# Altium project Industrial_IOT_Dev_Brd-v1.0.PrjPcb (part 4 of 7)

## Sheet Controller-Sheet.SchDoc
size 420 x 297 mm; SheetNumber: 3; SheetTotal: 9
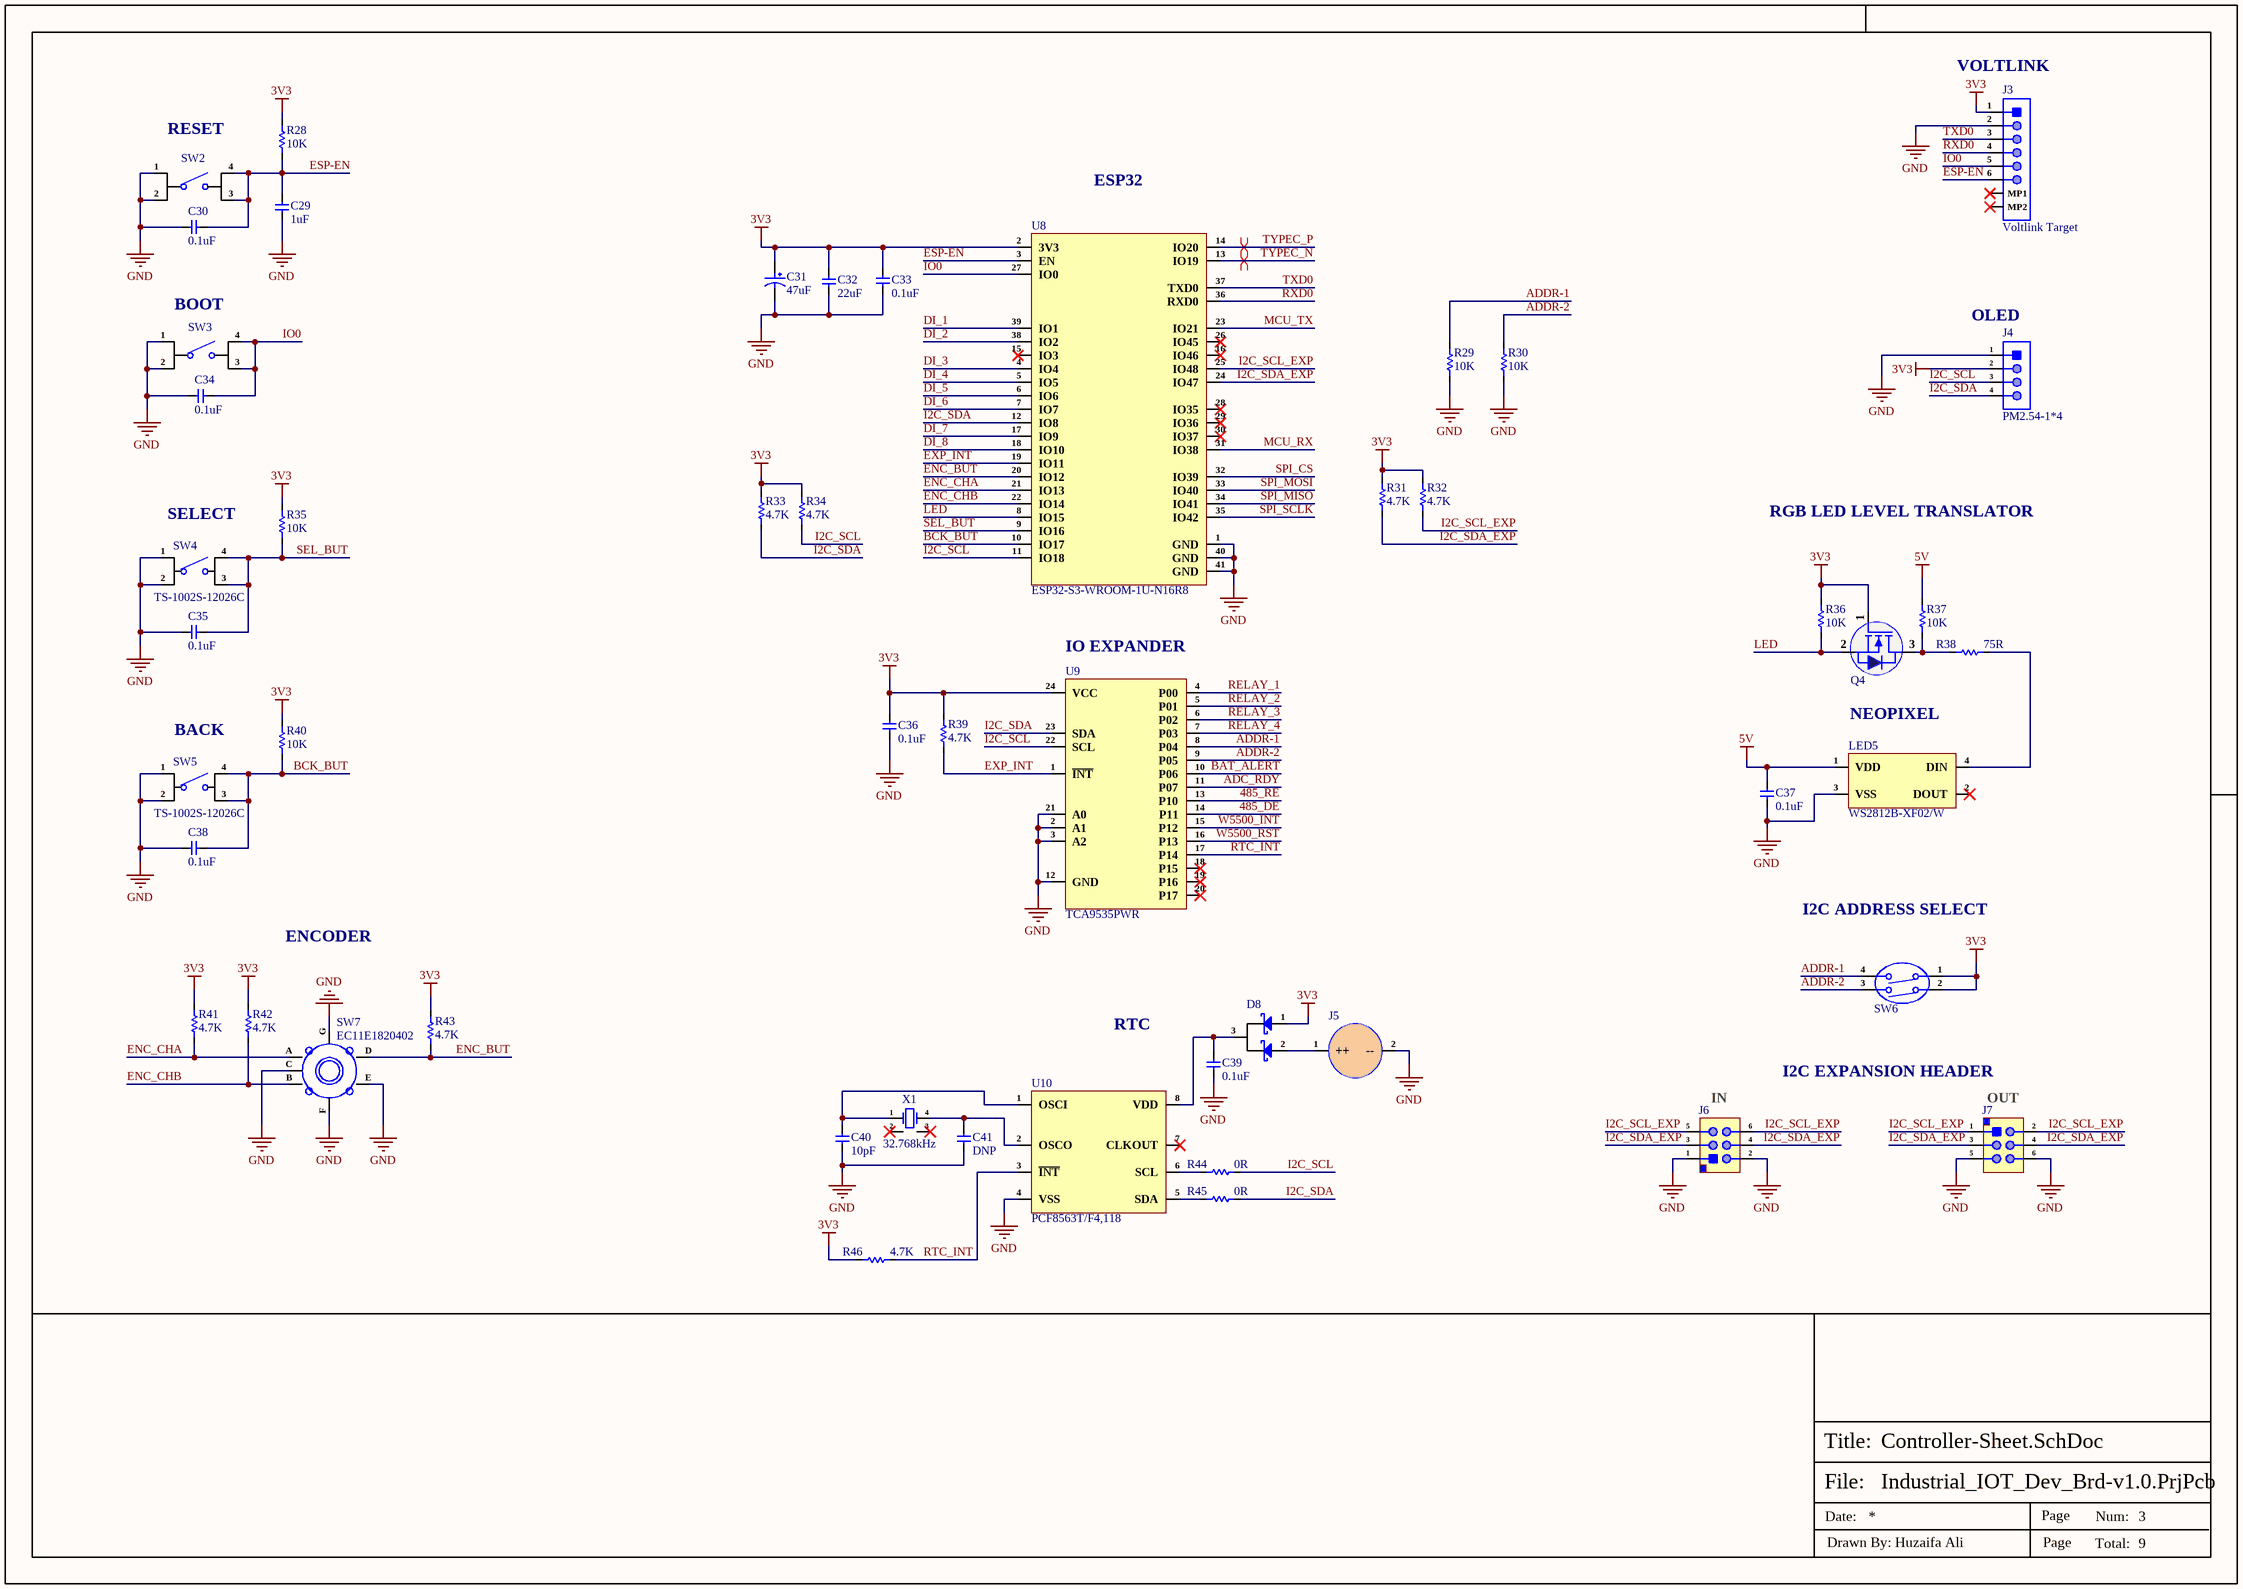
[diagram p2: Controller-Sheet.SchDoc]

### Parts
C29  1uF  [Cap-0402]
C30  0.1uF  [Cap-0402]
C31  47uF  [RVT1E470M0505]
C32  22uF  [Cap-0805]
C33  0.1uF  [Cap-0402]
C34  0.1uF  [Cap-0402]
C35  0.1uF  [Cap-0402]
C36  0.1uF  [Cap-0402]
C37  0.1uF  [Cap-0402]
C38  0.1uF  [Cap-0402]
C39  0.1uF  [Cap-0402]
C40  10pF  [Cap-0402]
C41  DNP  [Cap-0402]
D8  BAT54C  [SOT-23]  (value not drawn)
J3  Voltlink Target  [Voltlink Target]
J4  PM2.54-1*4  [HDR1X4 Female]
J5  CR2032-BS-6-1  [CR2032-BS-6-1]  (value not drawn)
J6  XDFH-0259-2*3P  [XDFH-0259-2*3P]  (value not drawn)
J7  XDFH-0259-2*3P  [XDFH-0259-2*3P]  (value not drawn)
LED5  WS2812B-XF02/W  [WS2812B-XF02/W]
Q4  Si2302CDS  [Sot-23]  (value not drawn)
R28  10K  [Res-0603]
R29  10K  [Res-0603]
R30  10K  [Res-0603]
R31  4.7K  [Res-0402]
R32  4.7K  [Res-0402]
R33  4.7K  [Res-0402]
R34  4.7K  [Res-0402]
R35  10K  [Res-0603]
R36  10K  [Res-0402]
R37  10K  [Res-0402]
R38  75R  [Res-0402]
R39  4.7K  [Res-0402]
R40  10K  [Res-0603]
R41  4.7K  [Res-0402]
R42  4.7K  [Res-0402]
R43  4.7K  [Res-0402]
R44  0R  [Res-0402]
R45  0R  [Res-0402]
R46  4.7K  [Res-0402]
SW2  TS-1109S-C-B  [TS-1109S-C-B]  (value not drawn)
SW3  TS-1109S-C-B  [TS-1109S-C-B]  (value not drawn)
SW4  TS-1002S-12026C  [TS-1002S-12026C]
SW5  TS-1002S-12026C  [TS-1002S-12026C]
SW6  DPL-02RP  [DPL-02RP]  (value not drawn)
SW7  EC11E1820402  [EC11E1820402]
U8  ESP32-S3-WROOM-1U-N16R8  [41-SMD UFL Module]
U9  TCA9535PWR  [24-TSSOP]
U10  PCF8563T/F4,118  [SOIC-8(0.154", 3.90mm Width)]
X1  32.768kHz  [MC-146_]

### Nets
3V3: C31.1 C32.2 C33.1 C36.1 D8.1(A) J3.1 J4.2 Q4.1(G) R28.2 R31.2 R32.2 R33.2 R34.2 R35.2 R36.2 R39.2 R40.2 R41.2 R42.2 R43.2 R46.2 SW6.1 SW6.2 U8.2(3V3) U9.24(VCC)
5V: C37.1 LED5.1(VDD) R37.2
GND: C29.1 C30.1 C31.2 C32.1 C33.2 C34.1 C35.1 C36.2 C37.2 C38.1 C39.1 C40.1 C41.1 J3.2 J4.1 J5.2(--) J6.1 J6.2 J7.5 J7.6 LED5.3(VSS) R29.1 R30.1 SW2.1 SW2.2 SW3.1 SW3.2 SW4.1 SW4.2 SW5.1 SW5.2 SW7.C SW7.E SW7.F SW7.G U8.1(GND) U8.40(GND) U8.41(GND) U9.2(A1) U9.3(A2) U9.12(GND) U9.21(A0) U10.4(VSS)
485_DE: U9.14(P11)
485_RE: U9.13(P10)
ADC_RDY: U9.11(P07)
ADDR-1: R29.2 SW6.4 U9.8(P04)
ADDR-2: R30.2 SW6.3 U9.9(P05)
BAT_ALERT: U9.10(P06)
BCK_BUT: C38.2 R40.1 SW5.3 SW5.4 U8.10(IO17)
DI_1: U8.39(IO1)
DI_2: U8.38(IO2)
DI_3: U8.4(IO4)
DI_4: U8.5(IO5)
DI_5: U8.6(IO6)
DI_6: U8.7(IO7)
DI_7: U8.17(IO9)
DI_8: U8.18(IO10)
ENC_BUT: R43.1 SW7.D U8.20(IO12)
ENC_CHA: R41.1 SW7.A U8.21(IO13)
ENC_CHB: R42.1 SW7.B U8.22(IO14)
ESP-EN: C29.2 C30.2 J3.6 R28.1 SW2.3 SW2.4 U8.3(EN)
EXP_INT: R39.1 U8.19(IO11) U9.1(~{INT})
I2C_SCL: J4.3 R34.1 R44.2 U8.11(IO18) U9.22(SCL)
I2C_SCL_EXP: J6.5 J6.6 J7.1 J7.2 R32.1 U8.25(IO48)
I2C_SDA: J4.4 R33.1 R45.2 U8.12(IO8) U9.23(SDA)
I2C_SDA_EXP: J6.3 J6.4 J7.3 J7.4 R31.1 U8.24(IO47)
IO0: C34.2 J3.5 SW3.3 SW3.4 U8.27(IO0)
LED: Q4.2(S) R36.1 U8.8(IO15)
MCU_RX: U8.31(IO38)
MCU_TX: U8.23(IO21)
RELAY_1: U9.4(P00)
RELAY_2: U9.5(P01)
RELAY_3: U9.6(P02)
RELAY_4: U9.7(P03)
RTC_INT: R46.1 U9.17(P14) U10.3(~{INT})
RXD0: J3.4 U8.36(RXD0)
SEL_BUT: C35.2 R35.1 SW4.3 SW4.4 U8.9(IO16)
SPI_CS: U8.32(IO39)
SPI_MISO: U8.34(IO41)
SPI_MOSI: U8.33(IO40)
SPI_SCLK: U8.35(IO42)
TXD0: J3.3 U8.37(TXD0)
TYPEC_N: U8.13(IO19)
TYPEC_P: U8.14(IO20)
W5500_INT: U9.15(P12)
W5500_RST: U9.16(P13)
NetC39_2: C39.2 D8.3(K) U10.8(VDD)
NetC40_2: C40.2 U10.1(OSCI) X1.1(OSC1)
NetC41_2: C41.2 U10.2(OSCO) X1.4(OSC2)
NetD8_2: D8.2(A) J5.1(++)
NetLED5_4: LED5.4(DIN) R38.2
NetQ4_3: Q4.3(D) R37.1 R38.1
NetR44_1: R44.1 U10.6(SCL)
NetR45_1: R45.1 U10.5(SDA)

Not connected (* = marked no-connect by the designer): J3 MP1* MP2*; LED5 2(DOUT)*; U8 15(IO3)* 16(IO46)* 26(IO45)* 28(IO35)* 29(IO36)* 30(IO37)*; U9 18(P15)* 19(P16)* 20(P17)*; U10 7(CLKOUT)*; X1 2(GND)* 3(GND)*

### Layout directives
differential pair; net class USB_PROGRAM; differential pair class USB_PROGRAM_LINES; rule Impedance Constraint [Min = 85.00    Max = 90.00    ]; rule Matched Net Lengths [Tolerance = 50mil]: TYPEC_N, TYPEC_P

### Notes on the sheet
- (near J3) VOLTLINK
- (near SW2) RESET
- ESP32
- (near SW3) BOOT
- (near J4) OLED
- (near SW4) SELECT
- RGB LED LEVEL TRANSLATOR
- (near U9) IO EXPANDER
- NEOPIXEL
- (near SW5) BACK
- ENCODER
- I2C ADDRESS SELECT
- RTC
- I2C EXPANSION HEADER
- (near J6) IN
- (near J7) OUT
- File:
- Title:
- Date:
- Page
- Num:
- Total:
- Drawn By: Huzaifa Ali

### Library data of the parts
C29 = GRM155R70J105KA12J: CAP CER 1UF 6.3V X7R 0402; Manufacturer: Murata; Item Type: Capacitors; Material: 4241ConductorMaterial; Tolerance: 10%; Supplier: Mouser; LCSC Part Number: C2167130; Manufacturer Part Number: GRM155R70J105KA12J; RoHS: Yes; Stock: 273640; Pricing: 1=0.1, 10=0.01, 50=0.01, 100=0.008, 1000=0.008, 10000=0.007 (USD); Mounting Technology: Surface Mount; Case/Package: 0402; Pins: 2NUMBER; Case Code (Metric): 1005; Case Code (Imperial): 0402; Weight: 0.000212oz; Min Operating Temperature: -55°C; Max Operating Temperature: 125°C; Packaging: Tape and Reel; Value: 1uF; Voltage Rating: 6.3V; Dielectric: X7R; Termination: SMD/SMT; Voltage Rating (DC): 6.3V; Package Quantity: 50000; Series: GRM; Length: 0.039inch; Width: 0.02inch; Height: 550um; Thickness: 0.022inch; RoHS Compliant: Yes; ComponentLink1URL: http://www.mouser.com/ds/2/281/c02e-2905.pdf?src-supplier=Mouser; ComponentLink1Description: http://www.mouser.com/ds/2/281/c02e-2905.pdf?src-supplier=Mouser; ComponentLink2URL: https://datasheet.octopart.com/GRM155R70J105KA12J-Murata-datasheet-32479577.pdf?src-supplier=Future+Electronics; ComponentLink2Description: https://datasheet.octopart.com/GRM155R70J105KA12J-Murata-datasheet-32479577.pdf?src-supplier=Future+Electronics; ComponentLink3URL: https://datasheet.octopart.com/GRM155R70J105KA12J-Murata-datasheet-155345054.pdf?src-supplier=Element14; ComponentLink3Description: https://datasheet.octopart.com/GRM155R70J105KA12J-Murata-datasheet-155345054.pdf?src-supplier=Element14; ComponentLink4URL: http://search.murata.co.jp/Ceramy/image/img/A01X/G101/ENG/GRM155R70J105KA12-01.pdf?src-supplier=Digikey; ComponentLink4Description: http://search.murata.co.jp/Ceramy/image/img/A01X/G101/ENG/GRM155R70J105KA12-01.pdf?src-supplier=Digikey; ComponentLink5URL: https://datasheet.octopart.com/GRM155R70J105KA12J-Murata-datasheet-165579666.pdf?src-supplier=TME; ComponentLink5Description: https://datasheet.octopart.com/GRM155R70J105KA12J-Murata-datasheet-165579666.pdf?src-supplier=TME
C30 C33-C39 = CC0402JRX7R7BB104: CAP CER 0.1UF 16V X7R 0402; Manufacturer: Yageo; Material: 4241ConductorMaterial; Value: 100nF; Tolerance: 5%; Item Type: Capacitor; Supplier: Digikey; Supplier Part Number: 311-1676-1-ND; Manufacturer Part Number: CC0402JRX7R7BB104; RoHS: Yes; Category: Ceramic Capacitors; Stock: 1659111; Pricing: 1=0.1, 10=0.046, 50=0.0262, 100=0.0203, 500=0.01528, 1000=0.012, 2500=0.01091, 5000=0.01004 (USD); Mounting Technology: Surface Mount; Case/Package: 0402; Case Code (Metric): 1005; Case Code (Imperial): 0402; Min Operating Temperature: -55°C; Max Operating Temperature: 125°C; Dielectric: X7R; Packaging: Tape and Reel; Package Quantity: 10000; Voltage Rating (DC): 16V; Voltage Rating: 16V; Series: CC; Construction: Flat; Length: 0.039inch; Width: 0.02inch; Height: 0.5mm; Thickness: 0.022inch; Lead Free: Lead Free; Halogen Free: Halogen Free; RoHS Compliant: Yes; ComponentLink1URL: https://datasheet.ciiva.com/13210/upy-gphc-x7r-6-3v-to-50v-8-12304-13210152.pdf?src-supplier=Mouser; ComponentLink1Description: https://datasheet.ciiva.com/13210/upy-gphc-x7r-6-3v-to-50v-8-12304-13210152.pdf?src-supplier=Mouser; LCSC Part Number: C541464
C31 = RVT1E470M0505: 47uF 25V 49mA@120Hz ±20% SMD,D5xL5.4mm Aluminum Electrolytic Capacitors - SMD ROHS; Manufacturer: ROQANG; Manufacturer Part Number: RVT1E470M0505; Package: SMD,D5xL5.4mm; LCSC Part Number: C2977553; Item Type: Capacitor; ComponentLink1Description: LCSC; ComponentLink1URL: https://www.lcsc.com/product-detail/Aluminum-Electrolytic-Capacitors-SMD_ROQANG-RVT1E470M0505_C2977553.html
C32 = GRM21BZ71A226ME15L: CAP CER 22UF 10V X7R 0805; Manufacturer: Murata; Material: 4241ConductorMaterial; Tolerance: 20%; Item Type: Capacitor; Supplier: Digi-Key; Supplier Part Number: 490-GRM21BZ71A226ME15LCT-ND; Manufacturer Part Number: GRM21BZ71A226ME15L; RoHS: Yes; Category: Ceramic Capacitors; Stock: 49126; Pricing: 1=0.39, 10=0.259, 50=0.191, 100=0.1556, 500=0.12282, 1000=0.10372 (USD); Package: 0805; Min Operating Temperature: -55°C; Max Operating Temperature: 125°C; Value: 22uF; Voltage Rating: 10V; Length: 2mm; Width: 1.25mm; Height: 1.45mm; Thickness: 1.25mm; ComponentLink1URL: https://datasheet.octopart.com/GRM21BZ71A226ME15L-Murata-datasheet-165579666.pdf?src-supplier=TME; ComponentLink1Description: https://datasheet.octopart.com/GRM21BZ71A226ME15L-Murata-datasheet-165579666.pdf?src-supplier=TME; LCSC Part Number: C907991; ComponentLink2Description: LCSC; ComponentLink2URL: https://www.lcsc.com/product-detail/Multilayer-Ceramic-Capacitors-MLCC-SMD-SMT_Murata-Electronics-GRM21BZ71A226ME15L_C907991.html
C40 C41 = GRM1555C1H100JA01D: CAP CER 10PF 50V C0G/NP0 0402; Manufacturer: Murata; Material: Ceramic; Dielectric: C0G; Tolerance: 5%; Item Type: Capacitor; Supplier: Arrow Electronics; Supplier Part Number: GRM1555C1H100JA01D; Manufacturer Part Number: GRM1555C1H100JA01D; RoHS: Yes; Category: Ceramic Capacitors; Stock: 3860000; Pricing: 10000=0.0034, 50000=0.0027, 100000=0.0023, 250000=0.0021 (USD); Mounting Technology: Surface Mount; Case/Package: 0402; Case Code (Metric): 1005; Case Code (Imperial): 0402; Min Operating Temperature: -55°C; Max Operating Temperature: 125°C; Value: 10pF; Voltage Rating: 50V; Packaging: Tape and Reel; Package Quantity: 1; Voltage Rating (DC): 50V; Termination: SMD/SMT; Series: GRM; Voltage: 50V; Construction: Flat; Length: 1mm; Width: 0.02inch; Height: 0.5mm; Depth: 0.5mm; Thickness: 0.022inch; Radiation Hardening: No; RoHS Compliant: Yes; Lead Free: Lead Free; Reach SVHC Compliant: No; ComponentLink1URL: https://datasheet.ciiva.com/2989/product-2989280.pdf?src-supplier=Avnet; ComponentLink1Description: https://datasheet.ciiva.com/2989/product-2989280.pdf?src-supplier=Avnet; ComponentLink2URL: https://datasheet.ciiva.com/18184/getdatasheetpartid-307234-18184164.pdf?src-supplier=Verical; ComponentLink2Description: https://datasheet.ciiva.com/18184/getdatasheetpartid-307234-18184164.pdf?src-supplier=Verical; ComponentLink3URL: https://datasheet.ciiva.com/29200/453545-da-01-en-vs-kondensator-0402-29200107.pdf?src-supplier=Conrad; ComponentLink3Description: https://datasheet.ciiva.com/29200/453545-da-01-en-vs-kondensator-0402-29200107.pdf?src-supplier=Conrad; ComponentLink4URL: https://datasheet.ciiva.com/7828/1666664-7828812.pdf?src-supplier=Element14; ComponentLink4Description: https://datasheet.ciiva.com/7828/1666664-7828812.pdf?src-supplier=Element14; ComponentLink5URL: https://datasheet.ciiva.com/6271/partnumbering-e-01-6271159.pdf?src-supplier=Digi-Key; ComponentLink5Description: https://datasheet.ciiva.com/6271/partnumbering-e-01-6271159.pdf?src-supplier=Digi-Key; ComponentLink6URL: https://datasheet.ciiva.com/6271/partnumbering-e-01-6271158.pdf?src-supplier=Digi-Key; ComponentLink6Description: https://datasheet.ciiva.com/6271/partnumbering-e-01-6271158.pdf?src-supplier=Digi-Key; ComponentLink7URL: https://datasheet.ciiva.com/6271/partnumbering-e-01-6271068.pdf?src-supplier=Digi-Key; ComponentLink7Description: https://datasheet.ciiva.com/6271/partnumbering-e-01-6271068.pdf?src-supplier=Digi-Key; LCSC Part Number: C76946
D8 = BAT54C: 30V Dual Common Cathode 1V@100mA 200mA SOT-23(TO-236) Schottky Barrier Diodes (SBD) ROHS; Manufacturer: Shandong Jingdao Microelectronics; Item Type: Diode; Manufacturer Part Number: BAT54C; LCSC Part Number: C2762215; ComponentLink1Description: LCSC; ComponentLink1URL: https://www.lcsc.com/product-detail/Schottky-Barrier-Diodes-SBD_Shandong-Jingdao-Microelectronics-BAT54C_C2762215.html; Package: SOT-23(TO-236)
J3 = C145963: 1x6P SH 1 1mm 6 SMD,P=1mm Wire To Board / Wire To Wire Connector ROHS; Manufacturer: BOOMELE; Manufacturer Part Number: C145963; Package: SMD,P=1mm; LCSC Part Number: C145963; Item Type: Connector; ComponentLink1Description: LCSC; ComponentLink1URL: https://www.lcsc.com/product-detail/Wire-To-Board-Wire-To-Wire-Connector_BOOMELE-Boom-Precision-Elec-C145963_C145963.html
J4 = PM2.54-1*4: 2mm 2.54mm Plugin 2.5A -40℃~+105℃ Straight 1x4P Top 8.5mm 4 Square Hole Plugin,P=2.54mm Female Headers ROHS; Manufacturer: ZHOURI; Manufacturer Part Number: PM2.54-1*4; Package: Plugin,P=2.54mm; LCSC Part Number: C5116530; Item Type: Female Header; ComponentLink1Description: LCSC; ComponentLink1URL: https://www.lcsc.com/product-detail/span-style-background-color-ff0-Female-span-Headers_ZHOURI-PM2-54-1-4_C5116530.html
J5 = CR2032-BS-6-1: Battery base CR2032 SMD Battery Connectors ROHS; Manufacturer: Q&J; Manufacturer Part Number: CR2032-BS-6-1; LCSC Part Number: C70377; Item Type: Connector; ComponentLink1Description: LCSC; ComponentLink1URL: https://www.lcsc.com/product-detail/Battery-Connectors_Q-J-CR2032-BS-6-1_C70377.html
J6 J7 = XDFH-0259-2*3P: -45℃~+105℃ Bend-in 3A Gold Copper 500V 2x3P 3 Simple cow constellation 2.54mm 2 Push-Pull,P=2.54mm IDC Connectors ROHS; Manufacturer: Lian Xin Technology; Manufacturer Part Number: XDFH-0259-2*3P; Package: Push-Pull,P=2.54mm; LCSC Part Number: C19193818; Item Type: IDC Connector; ComponentLink1Description: LCSC; ComponentLink1URL: https://www.lcsc.com/product-detail/IDC-Connectors_Lian-Xin-Technology-XDFH-0259-2-3P_C19193818.html
LED5 = WS2812B-XF02/W: SMD5050 Light Emitting Diodes (LED) ROHS; Manufacturer: Worldsemi; Item Type: RGB LED; Manufacturer Part Number: WS2812B-XF02/W; Package: SMD5050; LCSC Part Number: C4154882; ComponentLink1Description: LCSC; ComponentLink1URL: https://www.lcsc.com/product-detail/Light-Emitting-Diodes-LED_Worldsemi-WS2812B-XF02-W_C4154882.html
Q4 = Si2302CDS: N-CHANNEL 20-V (D-S) MOSFET; Manufacturer: TECH PUBLIC; ComponentLink1Description: LCSC; ComponentLink1URL: https://www.lcsc.com/product-detail/MOSFETs_TECH-PUBLIC-SI2302CDS_C5310968.html; Manufacturer Part Number: SI2302CDS; Package: SOT-23; LCSC Part Number: C5310968; Item Type: Mosfet
R28-R30 R35 R40 = RC0603FR-0710KL: RES SMD 10K Ohm 1% 1/10W 0603; Manufacturer: Yageo; Resistance: 10kR; Temperature Coefficient: 100ppm/°C; Voltage Rating (DC): 50V; Power Rating: 100mW; Voltage Rating: 75V; Item Type: Resistor; Supplier 1: Digi-Key; Manufacturer Part Number: RC0603FR-0710KL; RoHS: Yes; Category: Chip SMD Resistors; Stock 1: 25249139; Pricing 1: 1=0.10000, 10=0.02400, 100=0.00970, 1000=0.00436, 2500=0.00378 (USD); Case/Package: 0603; Number of Pins: 2; Case Code (Imperial): 0603; Case Code (Metric): 1608; Weight: 7.1E-05oz; Size Code: 0603; Min Operating Temperature: -55°C; Max Operating Temperature: 155°C; Tolerance: 1%; Resistor Type: Thick Film; Packaging: Tape and Reel; Termination: SMD/SMT; Features: Moisture Resistant; Series: RC; Max Power Dissipation: 100mW; Number of Terminations: 2; Resistance Tolerance: 1%; Construction: Rectangular; Length: 1.6mm; Width: 0.8mm; Height: 0.45mm; Depth: 0.8mm; Lead Pitch: 0.3mm; REACH SVHC: Unknown; Lead Free: Lead Free; Military Standard: Not; RoHS Compliant: Yes; ComponentLink1URL: https://datasheet.ciiva.com/7660/38590-7660789.pdf?src-supplier=Element14; ComponentLink1Description: https://datasheet.ciiva.com/7660/38590-7660789.pdf?src-supplier=Element14; ComponentLink2URL: https://datasheet.ciiva.com/7983/443971-7983596.pdf?src-supplier=Element14; ComponentLink2Description: https://datasheet.ciiva.com/7983/443971-7983596.pdf?src-supplier=Element14; ComponentLink3URL: https://datasheet.ciiva.com/22747/443971-22747519.pdf?src-supplier=Element14; ComponentLink3Description: https://datasheet.ciiva.com/22747/443971-22747519.pdf?src-supplier=Element14; ComponentLink4URL: https://datasheet.ciiva.com/46440/1868787-46440891.pdf?src-supplier=Element14; ComponentLink4Description: https://datasheet.ciiva.com/46440/1868787-46440891.pdf?src-supplier=Element14; ComponentLink5URL: https://datasheet.ciiva.com/7746/1738695-7746239.pdf?src-supplier=Element14; ComponentLink5Description: https://datasheet.ciiva.com/7746/1738695-7746239.pdf?src-supplier=Element14; ComponentLink6URL: https://datasheet.ciiva.com/15189/getdatasheetpartid-409289-15189591.pdf?src-supplier=Verical; ComponentLink6Description: https://datasheet.ciiva.com/15189/getdatasheetpartid-409289-15189591.pdf?src-supplier=Verical; Supplier Part Number 1: 311-10.0KHRCT-ND; LCSC Part Number: C98220
R31-R34 R39 R41-R43 R46 = RC0402FR-074K7L: RES 4.7K OHM 1% 1/16W 0402; Manufacturer: Yageo; Voltage Rating (DC): 50V; Power Rating: 62.5mW; Resistance: 4.7kR; Temperature Coefficient: 100ppm/°C; Max Power Dissipation: 63mW; Item Type: Resistor; Supplier 1: Avnet; Manufacturer Part Number: RC0402FR-074K7L; RoHS: Yes; Category: Chip SMD Resistors; Stock 1: 2420000; Pricing 1: 10000=0.00085 (USD); Case/Package: 0402; Number of Pins: 2; Case Code (Imperial): 0402; Case Code (Metric): 1005; Size Code: 0402; Min Operating Temperature: -55°C; Max Operating Temperature: 155°C; Tolerance: 1%; Voltage Rating: 50V; Packaging: Tape and Reel; Resistor Type: Thick Film; Termination: SMD/SMT; Features: Moisture Resistant; Series: RC; Number of Terminations: 2; Resistance Tolerance: 1%; Construction: Rectangular; Length: 1mm; Width: 0.5mm; Height: 0.32mm; Depth: 0.5mm; Height - Seated (Max): 0.016inch; RoHS Compliant: Yes; Reach SVHC Compliant: Yes; Military Standard: Not; Lead Free: Lead Free; ComponentLink1URL: https://datasheet.ciiva.com/22661/1686128-22661342.pdf?src-supplier=Element14; ComponentLink1Description: https://datasheet.ciiva.com/22661/1686128-22661342.pdf?src-supplier=Element14; ComponentLink2URL: https://datasheet.ciiva.com/7850/1018594-7850022.pdf?src-supplier=Element14; ComponentLink2Description: https://datasheet.ciiva.com/7850/1018594-7850022.pdf?src-supplier=Element14; ComponentLink3URL: https://datasheet.ciiva.com/7850/1018594-7850023.pdf?src-supplier=Element14; ComponentLink3Description: https://datasheet.ciiva.com/7850/1018594-7850023.pdf?src-supplier=Element14; ComponentLink4URL: https://datasheet.ciiva.com/15215/getdatasheetpartid-328119-15215035.pdf?src-supplier=Verical; ComponentLink4Description: https://datasheet.ciiva.com/15215/getdatasheetpartid-328119-15215035.pdf?src-supplier=Verical; Supplier Part Number 1: RC0402FR-074K7L; LCSC Part Number: C105871
R36 R37 = RC0402FR-0710KL: RES 10K OHM 1% 1/16W 0402; Manufacturer: Yageo; Resistance: 10kR; Voltage Rating (DC): 50V; Temperature Coefficient: 100ppm/°C; Power Rating: 62.5mW; Max Power Dissipation: 63mW; Item Type: Resistor; Supplier 1: Mouser; Manufacturer Part Number: RC0402FR-0710KL; RoHS: Yes; Category: Chip SMD Resistors; Stock 1: 18648329; Pricing 1: 1=0.10000, 10=0.01400, 50=0.01400, 100=0.00500, 1000=0.00300, 10000=0.00200 (USD); Case/Package: 0402; Number of Pins: 2; Case Code (Imperial): 0402; Case Code (Metric): 1005; Min Operating Temperature: -55°C; Max Operating Temperature: 155°C; Resistor Type: Thick Film; Tolerance: 1%; Packaging: Tape and Reel; Voltage Rating: 50V; Termination: SMD/SMT; Working Voltage: 50V; Number of Terminations: 2; Features: Moisture Resistant; Series: RC; Resistance Tolerance: 1%; Construction: Rectangular; Length: 1mm; Width: 0.5mm; Height: 0.32mm; Depth: 0.5mm; Lead Pitch: 0.2mm; REACH SVHC: No SVHC; Lead Free: Lead Free; RoHS Compliant: Yes; Military Standard: Not; ComponentLink1URL: https://datasheet.ciiva.com/7660/38568-7660787.pdf?src-supplier=Element14; ComponentLink1Description: https://datasheet.ciiva.com/7660/38568-7660787.pdf?src-supplier=Element14; ComponentLink2URL: https://datasheet.ciiva.com/7849/1686128-7849814.pdf?src-supplier=Element14; ComponentLink2Description: https://datasheet.ciiva.com/7849/1686128-7849814.pdf?src-supplier=Element14; ComponentLink3URL: https://datasheet.ciiva.com/7983/1018594-7983486.pdf?src-supplier=Element14; ComponentLink3Description: https://datasheet.ciiva.com/7983/1018594-7983486.pdf?src-supplier=Element14; ComponentLink4URL: https://datasheet.ciiva.com/22747/1018594-22747512.pdf?src-supplier=Element14; ComponentLink4Description: https://datasheet.ciiva.com/22747/1018594-22747512.pdf?src-supplier=Element14; ComponentLink5URL: https://datasheet.ciiva.com/12667/pyu-rc0402-51-rohs-l-6-r-12667067.pdf?src-supplier=Mouser; ComponentLink5Description: https://datasheet.ciiva.com/12667/pyu-rc0402-51-rohs-l-6-r-12667067.pdf?src-supplier=Mouser; ComponentLink6URL: https://datasheet.ciiva.com/7849/1784430-7849813.pdf?src-supplier=Element14; ComponentLink6Description: https://datasheet.ciiva.com/7849/1784430-7849813.pdf?src-supplier=Element14; ComponentLink7URL: https://datasheet.ciiva.com/7849/1784430-7849815.pdf?src-supplier=Element14; ComponentLink7Description: https://datasheet.ciiva.com/7849/1784430-7849815.pdf?src-supplier=Element14; Supplier Part Number 1: 603-RC0402FR-0710KL; LCSC Part Number: C60490
R38 = RC0402JR-0775RL: RES 75 OHM 5% 1/16W 0402; Manufacturer: Yageo; Item Type: Resistor; Temperature Coefficient: 100ppm/°C; Power Rating: 62.5mW; Voltage Rating: 50V; Max Power Dissipation: 63mW; Supplier: Digikey; Supplier Part Number: 311-75JRCT-ND; Manufacturer Part Number: RC0402JR-0775RL; RoHS: Yes; Stock: 2993323; Pricing: 1=0.1, 10=0.018, 50=0.0102, 100=0.0083, 500=0.00528, 1000=0.00444, 5000=0.00307 (USD); Case/Package: 0402; Pins: 2; Contact Plating: Tin,Lead; Case Code (Imperial): 0402; Case Code (Metric): 1005; Min Operating Temperature: -55°C; Max Operating Temperature: 155°C; Value: 75R; Tolerance: 5%; Resistor Type: Thick Film; Packaging: Tape and Reel; Termination: SMD/SMT; Voltage Rating (DC): 50V; Features: Moisture Resistant; Series: RC; Number of Terminations: 2; Resistance Tolerance: 5%; Length: 1mm; Width: 0.5mm; Height: 0.35mm; Reach SVHC Compliant: No; Lead Free: Lead Free; RoHS Compliant: Yes; ComponentLink1URL: https://datasheet.ciiva.com/7983/1018594-7983612.pdf?src-supplier=Element14; ComponentLink1Description: https://datasheet.ciiva.com/7983/1018594-7983612.pdf?src-supplier=Element14; ComponentLink2URL: https://datasheet.ciiva.com/17082/pyu-rc0402-51-rohs-l-6-r-17082239.pdf?src-supplier=Future+Electronics; ComponentLink2Description: https://datasheet.ciiva.com/17082/pyu-rc0402-51-rohs-l-6-r-17082239.pdf?src-supplier=Future+Electronics; LCSC Part Number: C137841
R44 R45 = RC0402FR-070RL: RES 0 OHM JUMPER 1/16W 0402; Manufacturer: Yageo; Item Type: Resistors; Tolerance: 1%; Power Rating: 62.5mW; Voltage Rating: 50V; Temperature Coefficient: 200ppm/°C; Max Power Dissipation: 63mW; Supplier 1: Mouser; Manufacturer Part Number: RC0402FR-070RL; RoHS: Yes; Stock 1: 8556842; Pricing 1: 1=0.10000, 10=0.01400, 50=0.01400, 100=0.00600, 1000=0.00300, 5000=0.00200, 10000=0.00100 (USD); Mount: Surface Mount; Case/Package: 0402; Contact Plating: Tin,Matte; Case Code (Imperial): 0402; Case Code (Metric): 1005; Size Code: 0402; Min Operating Temperature: -55°C; Max Operating Temperature: 155°C; Resistance: 0R; Resistor Type: Thick Film; Packaging: Tape and Reel; Termination: SMD/SMT; Features: Moisture Resistant; Series: RC; Number of Terminations: 2; Length: 1mm; Width: 0.5mm; Height: 0.35mm; Radiation Hardening: No; Lead Free: Lead Free; RoHS Compliant: Yes; ComponentLink1URL: https://datasheet.ciiva.com/8896/pyu-rc0402-51-rohs-l-6-8896149.pdf?src-supplier=Avnet; ComponentLink1Description: https://datasheet.ciiva.com/8896/pyu-rc0402-51-rohs-l-6-8896149.pdf?src-supplier=Avnet; ComponentLink2URL: https://datasheet.ciiva.com/16790/pyu-rc0402-51-rohs-l-6-r-16790444.pdf?src-supplier=Future+Electronics; ComponentLink2Description: https://datasheet.ciiva.com/16790/pyu-rc0402-51-rohs-l-6-r-16790444.pdf?src-supplier=Future+Electronics; Supplier Part Number 1: 603-RC0402FR-070RL; LCSC Part Number: C106231
SW2 SW3 = TS-1109S-C-B: No NO 50mA 4.5mm 100000 260gf 12V -30℃~+85℃ 4.5mm 4.3mm Black Round Button Brick nogging SPST SMD Tactile Switches ROHS; Manufacturer: XKB Connectivity; Item Type: Switch; Manufacturer Part Number: TS-1109S-C-B; Package: Custom; LCSC Part Number: C381037; ComponentLink1Description: LCSC; ComponentLink1URL: https://www.lcsc.com/product-detail/Tactile-Switches_XKB-Connectivity-TS-1109S-C-B_C381037.html
SW4 SW5 = TS-1002S-12026C: 6mm 12mm Round Button 50mA Standing paste 6mm SPST 12V SMD,6x6mm Tactile Switches ROHS; Manufacturer: XUNPU; Manufacturer Part Number: TS-1002S-12026C; Package: SMD,6x6mm; LCSC Part Number: C455124; Item Type: Tactile Switch; ComponentLink1Description: LCSC; ComponentLink1URL: https://www.lcsc.com/product-detail/Tactile-Switches_XUNPU-TS-1002S-12026C_C455124.html?s_z=n_TS-1002S-12026C
SW6 = DPL-02RP: 2 positions SPST 24V 25mA Red 3000 Times Piano Key Plugin DIP Switches ROHS; Manufacturer: XKB Connection; Item Type: SMD-4P; Manufacturer Part Number: DPL-02RP; Package: Plugin; LCSC Part Number: C319071; ComponentLink1Description: LCSC; ComponentLink1URL: https://www.lcsc.com/product-detail/DIP-Switches_XKB-Connection-DPL-02RP_C319071.html
SW7 = EC11E1820402: METAL SHAFT ENCODERS; Manufacturer: Alps Electric; Number of Positions: 36NUMBER; Supplier: Digikey; LCSC Part Number: C361167; Manufacturer Part Number: EC11E1820402; RoHS: Yes; Item Type: Encoders; Stock: 643; Pricing: 1=4.42, 5=3.992, 10=3.731, 25=3.4196, 40=3.1905, 80=3.00238, 230=2.74883, 440=2.57702, 945=2.4134 (USD); Lead Free: 5697LeadFree; ComponentLink1URL: https://datasheet.ciiva.com/11807/0900766b80f4c221-11807942.pdf?src-supplier=Rs; ComponentLink1Description: https://datasheet.ciiva.com/11807/0900766b80f4c221-11807942.pdf?src-supplier=Rs; ComponentLink2URL: https://datasheet.ciiva.com/1310/1837001-1310650.pdf?src-supplier=Element14; ComponentLink2Description: https://datasheet.ciiva.com/1310/1837001-1310650.pdf?src-supplier=Element14; ComponentLink3URL: https://datasheet.ciiva.com/32416/03584604-32416390.pdf?src-supplier=Distrelec; ComponentLink3Description: https://datasheet.ciiva.com/32416/03584604-32416390.pdf?src-supplier=Distrelec; ComponentLink4URL: https://datasheet.ciiva.com/16204/878ec11-16204694.pdf?src-supplier=Onlinecomponents.com; ComponentLink4Description: https://datasheet.ciiva.com/16204/878ec11-16204694.pdf?src-supplier=Onlinecomponents.com
U8 = ESP32-S3-WROOM-1U-N16R8: RF TXRX MOD BLUETOOTH U.FL SMD; Manufacturer: Espressif Systems; Item Type: IC; Supplier: Digikey; LCSC Part Number: C3013946; Manufacturer Part Number: ESP32-S3-WROOM-1U-N16R8; RoHS: No; Stock: 3681; Pricing: 1=3.9 (USD)
U9 = TCA9535PWR: IC XPND 400KHZ I2C SMBUS 24TSSOP; Manufacturer: Texas Instruments; Supplier: Mouser; Supplier Part Number: 595-TCA9535PWR; Manufacturer Part Number: TCA9535PWR; RoHS: Yes; Category: Interface ICs; Stock: 12963; Pricing: 1=1.22, 10=0.799, 50=0.799, 100=0.663, 1000=0.615, 10000=0.557 (USD); Length: 7.8mm; Width: 4.4mm; Height: 1.2mm; Thickness: 1mm; Lead Free: 5697LeadFree; ComponentLink1URL: https://datasheet.ciiva.com/4826/scps201a-101401-4826418.pdf?src-supplier=Mouser; ComponentLink1Description: https://datasheet.ciiva.com/4826/scps201a-101401-4826418.pdf?src-supplier=Mouser; ComponentLink2URL: https://datasheet.ciiva.com/22652/scps201a-22652097.pdf?src-supplier=Element14; ComponentLink2Description: https://datasheet.ciiva.com/22652/scps201a-22652097.pdf?src-supplier=Element14; ComponentLink3URL: https://datasheet.ciiva.com/1780/tca9535-1780411.pdf?src-supplier=Digikey; ComponentLink3Description: https://datasheet.ciiva.com/1780/tca9535-1780411.pdf?src-supplier=Digikey; ComponentLink4URL: https://datasheet.ciiva.com/14195/tca9535-14195180.pdf?src-supplier=Avnet; ComponentLink4Description: https://datasheet.ciiva.com/14195/tca9535-14195180.pdf?src-supplier=Avnet; Package: TSSOP-24; LCSC Part Number: C130204; Item Type: IC
U10 = PCF8563T/F4,118: IC RTC CLOCK/CALENDAR I2C 8SO; Manufacturer: NXP Semiconductors; Max Supply Voltage: 5.5V; Min Supply Voltage: 1.8V; Logic Function: Clock; Time Format: HH:MM:SS; Supplier: Future Electronics; LCSC Part Number: C80798; Manufacturer Part Number: PCF8563T/F4,118; RoHS: Yes; Item Type: IC; Stock: 77500; Pricing: 2500=0.71 (USD); Mounting Technology: Surface Mount; Case/Package: SO; Pins: 8; Weight: 0.019048oz; Min Operating Temperature: -40°C; Max Operating Temperature: 85°C; Packaging: Tape and Reel; Interface: I2C; Nominal Supply Voltage: 5.5V; Radiation Hardening: No; Lead Free: Lead Free; Temperature Grade: INDUSTRIAL; RoHS Compliant: Yes; ComponentLink1URL: https://datasheet.ciiva.com/6668/pcf8563-6668170.pdf?src-supplier=Digikey; ComponentLink1Description: https://datasheet.ciiva.com/6668/pcf8563-6668170.pdf?src-supplier=Digikey; ComponentLink2URL: https://datasheet.ciiva.com/6668/pcf8563-6668166.pdf?src-supplier=Digikey; ComponentLink2Description: https://datasheet.ciiva.com/6668/pcf8563-6668166.pdf?src-supplier=Digikey; ComponentLink3URL: https://datasheet.ciiva.com/6668/pcf8563-6668174.pdf?src-supplier=Digikey; ComponentLink3Description: https://datasheet.ciiva.com/6668/pcf8563-6668174.pdf?src-supplier=Digikey; ComponentLink4URL: https://datasheet.ciiva.com/4771/pcf8563-4771994.pdf?src-supplier=Mouser; ComponentLink4Description: https://datasheet.ciiva.com/4771/pcf8563-4771994.pdf?src-supplier=Mouser; ComponentLink5URL: https://datasheet.ciiva.com/15225/getdatasheetpartid-633364-15225014.pdf?src-supplier=Verical; ComponentLink5Description: https://datasheet.ciiva.com/15225/getdatasheetpartid-633364-15225014.pdf?src-supplier=Verical; ComponentLink6URL: https://datasheet.ciiva.com/8144/pcf8563-8144541.pdf?src-supplier=Avnet; ComponentLink6Description: https://datasheet.ciiva.com/8144/pcf8563-8144541.pdf?src-supplier=Avnet
X1 = Q13MC14620001: 32.768kHz 7pF ±20ppm MC-146 Crystals ROHS; Manufacturer: Seiko Epson; Manufacturer Part Number: Q13MC14620001; Package: MC-146; LCSC Part Number: C3013800; Item Type: Crystals; ComponentLink1Description: LCSC; ComponentLink1URL: https://www.lcsc.com/product-detail/Crystals_Seiko-span-style-background-color-ff0-Epson-span-Q13MC14620001_C3013800.html

## Sheet Power-Relay-Sheet.SchDoc
size 420 x 297 mm; SheetNumber: 4; SheetTotal: 9
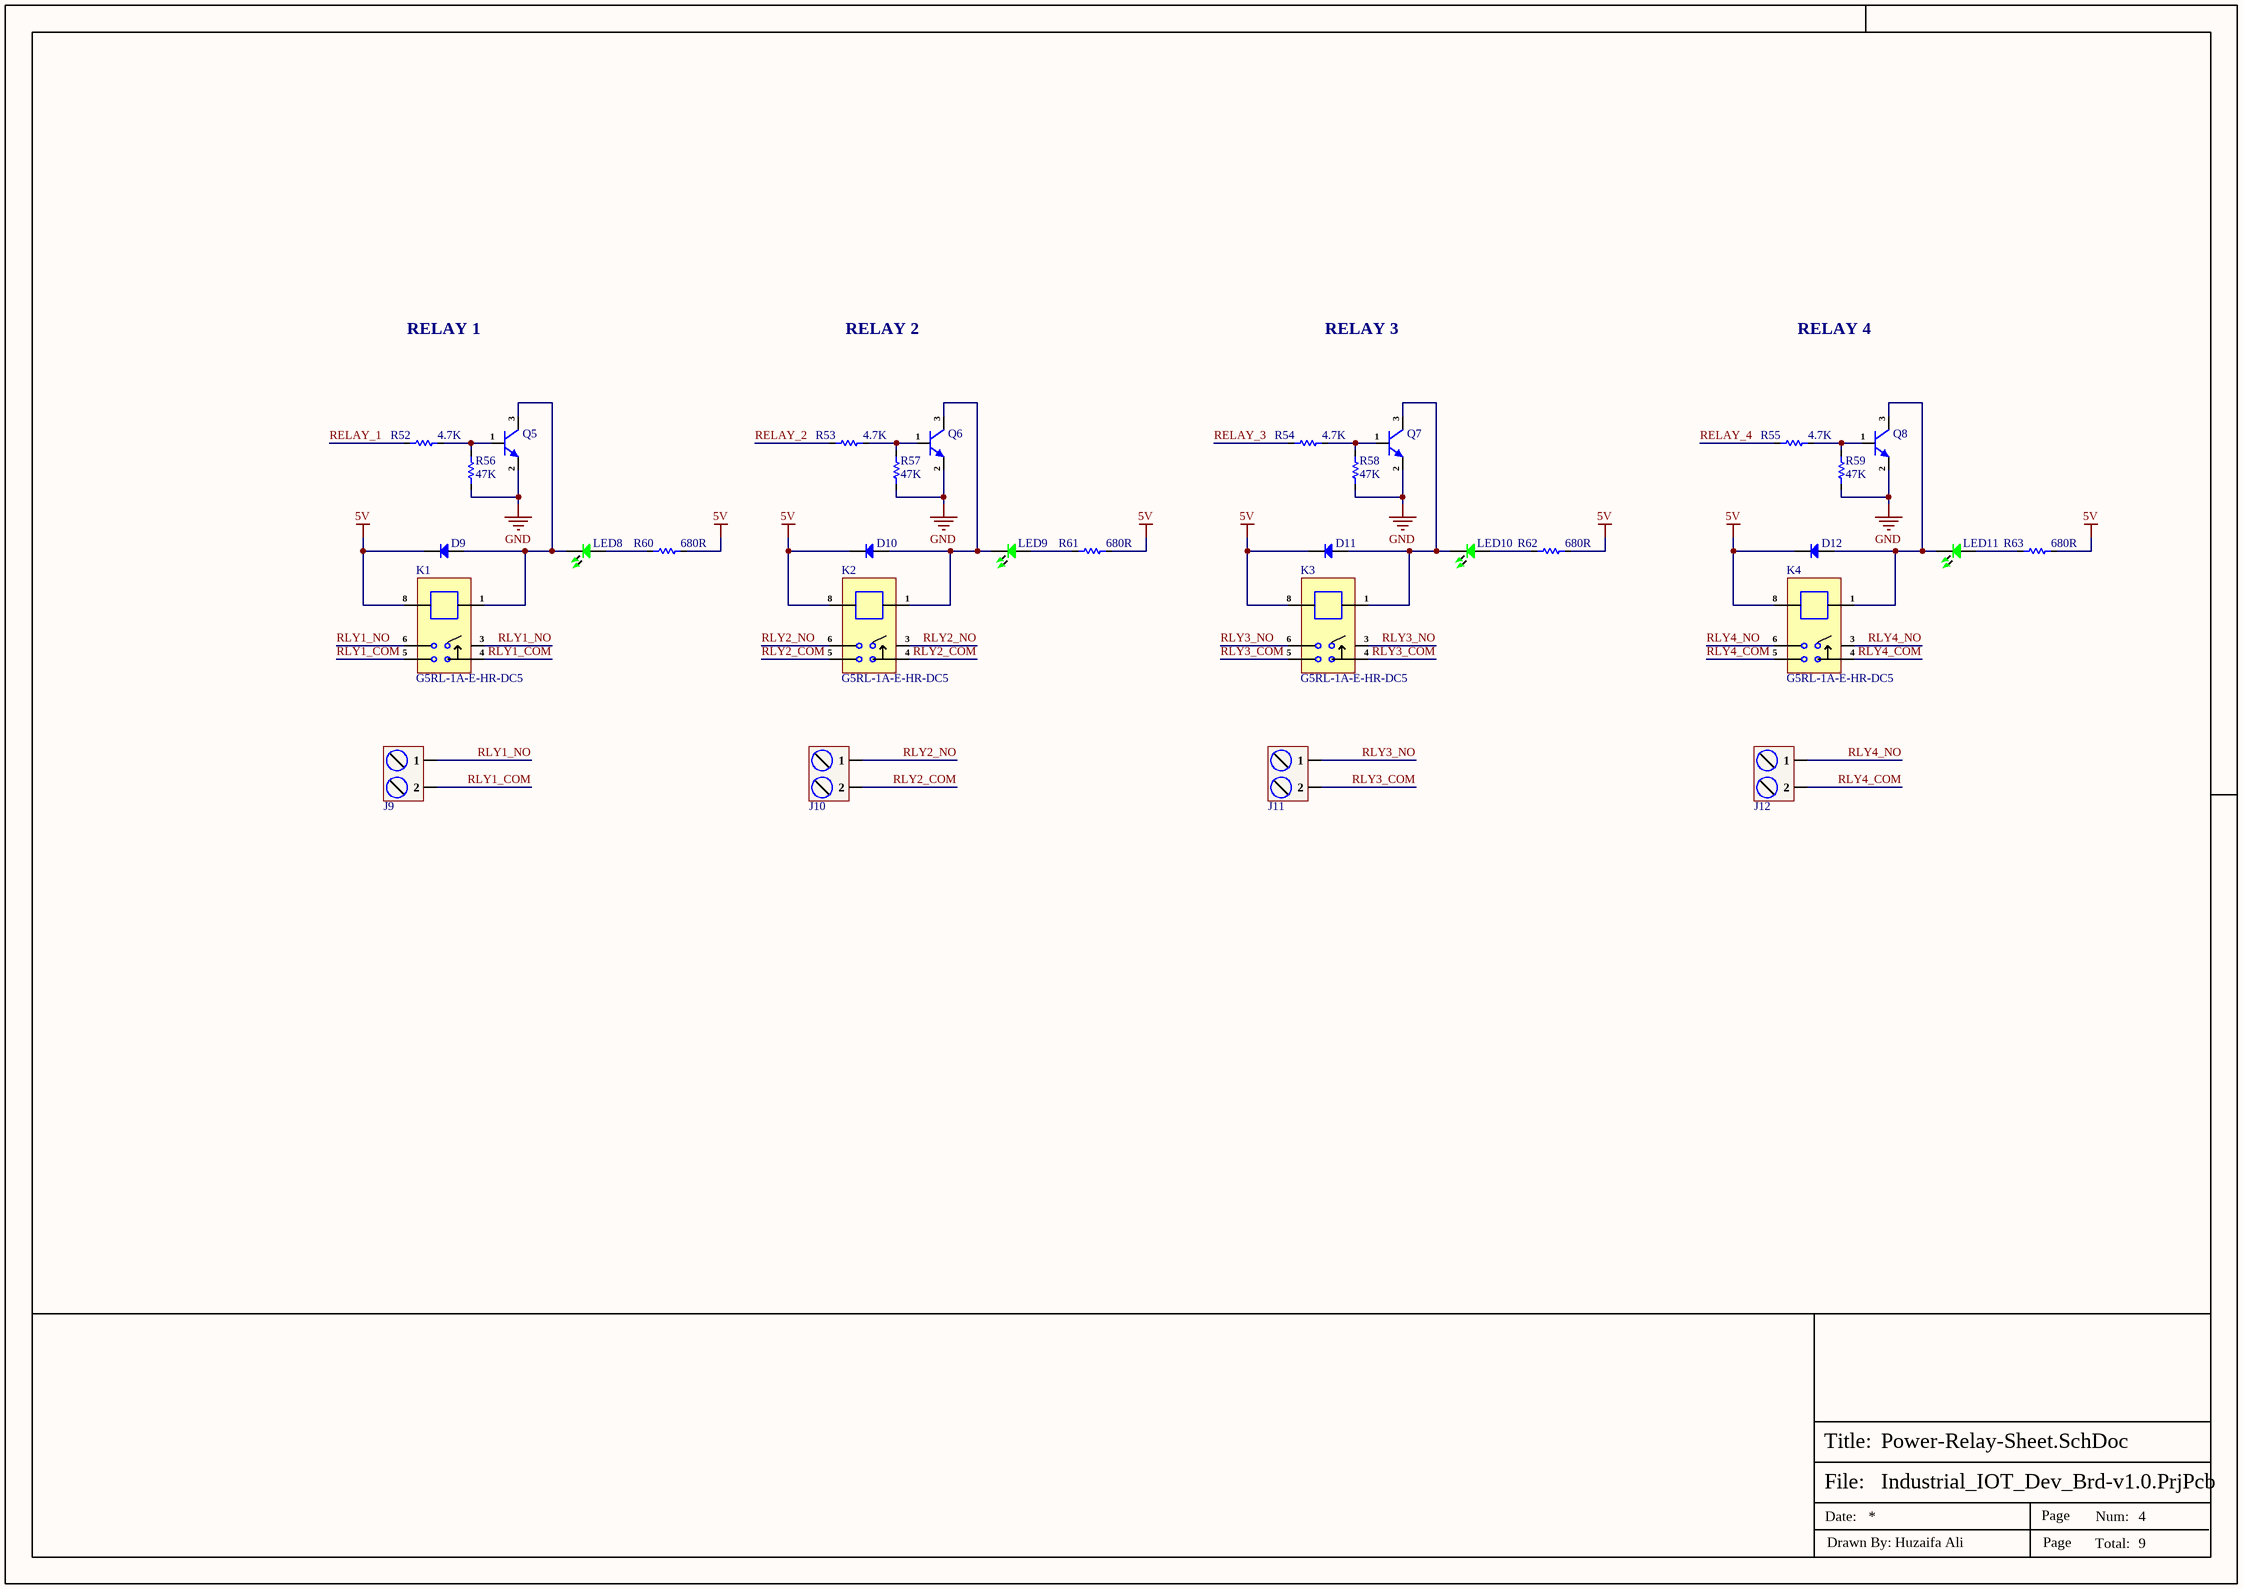
[diagram p3: Power-Relay-Sheet.SchDoc]

### Parts
D9  1N4148W-7-F  [SOD-123]  (value not drawn)
D10  1N4148W-7-F  [SOD-123]  (value not drawn)
D11  1N4148W-7-F  [SOD-123]  (value not drawn)
D12  1N4148W-7-F  [SOD-123]  (value not drawn)
J9  DB128L-5.08-2P-GN-S  [DB128L-5.08-2P-GN-S]  (value not drawn)
J10  DB128L-5.08-2P-GN-S  [DB128L-5.08-2P-GN-S]  (value not drawn)
J11  DB128L-5.08-2P-GN-S  [DB128L-5.08-2P-GN-S]  (value not drawn)
J12  DB128L-5.08-2P-GN-S  [DB128L-5.08-2P-GN-S]  (value not drawn)
K1  G5RL-1A-E-HR-DC5  [G5RL-1A-E-HR-DC5]
K2  G5RL-1A-E-HR-DC5  [G5RL-1A-E-HR-DC5]
K3  G5RL-1A-E-HR-DC5  [G5RL-1A-E-HR-DC5]
K4  G5RL-1A-E-HR-DC5  [G5RL-1A-E-HR-DC5]
LED8  Emerald  [LED-0603]  (value not drawn)
LED9  Emerald  [LED-0603]  (value not drawn)
LED10  Emerald  [LED-0603]  (value not drawn)
LED11  Emerald  [LED-0603]  (value not drawn)
Q5  MMBT3904M  [SOT-723]  (value not drawn)
Q6  MMBT3904M  [SOT-723]  (value not drawn)
Q7  MMBT3904M  [SOT-723]  (value not drawn)
Q8  MMBT3904M  [SOT-723]  (value not drawn)
R52  4.7K  [Res-0402]
R53  4.7K  [Res-0402]
R54  4.7K  [Res-0402]
R55  4.7K  [Res-0402]
R56  47K  [Res-0402]
R57  47K  [Res-0402]
R58  47K  [Res-0402]
R59  47K  [Res-0402]
R60  680R  [Res-0402]
R61  680R  [Res-0402]
R62  680R  [Res-0402]
R63  680R  [Res-0402]

### Nets
5V: D9.2(K) D10.2(K) D11.2(K) D12.2(K) K1.8 K2.8 K3.8 K4.8 R60.2 R61.2 R62.2 R63.2
GND: Q5.2(E) Q6.2(E) Q7.2(E) Q8.2(E) R56.1 R57.1 R58.1 R59.1
RELAY_1: R52.1
RELAY_2: R53.1
RELAY_3: R54.1
RELAY_4: R55.1
RLY1_COM: J9.2 K1.4 K1.5
RLY1_NO: J9.1 K1.3 K1.6
RLY2_COM: J10.2 K2.4 K2.5
RLY2_NO: J10.1 K2.3 K2.6
RLY3_COM: J11.2 K3.4 K3.5
RLY3_NO: J11.1 K3.3 K3.6
RLY4_COM: J12.2 K4.4 K4.5
RLY4_NO: J12.1 K4.3 K4.6
NetD9_1: D9.1(A) K1.1 LED8.2 Q5.3(C)
NetD10_1: D10.1(A) K2.1 LED9.2 Q6.3(C)
NetD11_1: D11.1(A) K3.1 LED10.2 Q7.3(C)
NetD12_1: D12.1(A) K4.1 LED11.2 Q8.3(C)
NetLED8_1: LED8.1 R60.1
NetLED9_1: LED9.1 R61.1
NetLED10_1: LED10.1 R62.1
NetLED11_1: LED11.1 R63.1
NetQ5_1: Q5.1(B) R52.2 R56.2
NetQ6_1: Q6.1(B) R53.2 R57.2
NetQ7_1: Q7.1(B) R54.2 R58.2
NetQ8_1: Q8.1(B) R55.2 R59.2

### Notes on the sheet
- RELAY 1
- RELAY 2
- RELAY 3
- RELAY 4
- File:
- Title:
- Date:
- Page
- Num:
- Total:
- Drawn By: Huzaifa Ali

### Library data of the parts
D9-D12 = 1N4148W-7-F: DIODE GEN PURP 100V 300MA SOD123; Manufacturer: Diodes; Forward Current: 150mA; Reverse Recovery Time: 4ns; Max Forward Surge Current (Ifsm): 2A; Element Configuration: Single; Max Reverse Current: 1uA; Forward Voltage: 1.25V; Power Dissipation: 400mW; Polarity: Standard; Voltage Rating (DC): 75V; Value: 2pF; Supplier 1: Future Electronics; Manufacturer Part Number: 1N4148W-7-F; RoHS: Yes; Category: Rectifier Diodes; Stock 1: 32931000; Pricing 1: 3000=0.01840, 12000=0.01760, 45000=0.01690, 120000=0.01640, 300000=0.01560 (USD); Mounting Technology: Surface Mount; Pins: 2; Weight: 0.000353oz; Contact Plating: Tin,Matte; Min Operating Temperature: -65°C; Max Operating Temperature: 150°C; Packaging: Tape and Reel; Max Repetitive Reverse Voltage (Vrrm): 100V; Peak Non-Repetitive Surge Current: 2A; Voltage: 100V; Max Surge Current: 2A; Package Quantity: 3000; Recovery Time: 4ns; Average Rectified Current: 300mA; Power Rating: 400mW; Current Rating: 150mA; Output Current: 150mA; Max Reverse Voltage (DC): 100V; Series: -; Reverse Recovery Time-Max: 4ns; Length: 2.85mm; Width: 1.7mm; Height: 1.25mm; Radiation Hardening: No; RoHS Compliant: Yes; Reach SVHC Compliant: Yes; Lead Free: Lead Free; ComponentLink1URL: https://datasheet.ciiva.com/1179/1915529-1179304.pdf?src-supplier=Element14; ComponentLink1Description: https://datasheet.ciiva.com/1179/1915529-1179304.pdf?src-supplier=Element14; ComponentLink2URL: https://datasheet.ciiva.com/22695/1915529-22695239.pdf?src-supplier=Element14; ComponentLink2Description: https://datasheet.ciiva.com/22695/1915529-22695239.pdf?src-supplier=Element14; ComponentLink3URL: https://datasheet.ciiva.com/8300/ds30086-8300392.pdf?src-supplier=Avnet; ComponentLink3Description: https://datasheet.ciiva.com/8300/ds30086-8300392.pdf?src-supplier=Avnet; ComponentLink4URL: https://datasheet.ciiva.com/15219/getdatasheetpartid-110030-15219548.pdf?src-supplier=Verical; ComponentLink4Description: https://datasheet.ciiva.com/15219/getdatasheetpartid-110030-15219548.pdf?src-supplier=Verical; ComponentLink5URL: https://datasheet.ciiva.com/8303/ds30086-8303197.pdf?src-supplier=Avnet; ComponentLink5Description: https://datasheet.ciiva.com/8303/ds30086-8303197.pdf?src-supplier=Avnet; ComponentLink6URL: https://datasheet.ciiva.com/911/ds30086-911735.pdf?src-supplier=Digi-Key; ComponentLink6Description: https://datasheet.ciiva.com/911/ds30086-911735.pdf?src-supplier=Digi-Key; ComponentLink7URL: https://datasheet.ciiva.com/911/ds30086-911736.pdf?src-supplier=Digi-Key; ComponentLink7Description: https://datasheet.ciiva.com/911/ds30086-911736.pdf?src-supplier=Digi-Key; ComponentLink8URL: https://datasheet.ciiva.com/911/ds30086-911734.pdf?src-supplier=Digi-Key; ComponentLink8Description: https://datasheet.ciiva.com/911/ds30086-911734.pdf?src-supplier=Digi-Key; ComponentLink9URL: https://datasheet.ciiva.com/4435/ds30086-4435128.pdf?src-supplier=Mouser; ComponentLink9Description: https://datasheet.ciiva.com/4435/ds30086-4435128.pdf?src-supplier=Mouser; Supplier Part Number 1: 7634694; LCSC Part Number: C83528; Item Type: Diode
J9-J12 = DB128L-5.08-2P-GN-S: 1x2P 18A -40℃~+105℃ 250V Green 12~30 Straight 5.08mm 2.5 1 2 Plugin,P=5.08mm Screw terminal ROHS; Manufacturer: DORABO; Item Type: Terminal Block; Manufacturer Part Number: DB128L-5.08-2P-GN-S; Package: Plugin,P=5.08mm; LCSC Part Number: C395868; ComponentLink1Description: LCSC; ComponentLink1URL: https://www.lcsc.com/product-detail/Screw-terminal_DORABO-DB128L-5-08-2P-GN-S_C395868.html
K1-K4 = G5RL-1A-E-HR-DC5: RELAY GEN PURPOSE SPST 16A 5V; Manufacturer: Omron; Item Type: Power Relays; Power Rating: 400mW; Max Voltage Rating (AC): 250V; Max Voltage Rating (DC): 24V; Operate Time: 15ms; Coil Current: 80mA; Coil Resistance: 62.5R; Supplier: Digikey; LCSC Part Number: C113250; Manufacturer Part Number: G5RL-1A-E-HR-DC5; RoHS: Yes; Stock: 529; Pricing: 1=4.95, 10=4.327, 25=4.1008, 50=3.9372, 100=3.7801, 300=3.54387, 500=3.43916, 1000=3.30195 (USD); Mounting Technology: Through Hole; Case/Package: DIP; Pins: 6; Contact Material: Silver,Cadmium; Weight: 10g; Min Operating Temperature: -40°C; Max Operating Temperature: 85°C; Contact Current Rating: 16A; Max Current Rating: 16A; Throw Configuration: SPST; Termination: PC Pin; Power Consumption: 400mW; Coil Voltage (DC): 5V; Width: 12.7mm; Height: 15.7mm; Lead Free: Lead Free; ComponentLink1URL: https://datasheet.ciiva.com/5233/g5rl-0911-9106-5233888.pdf?src-supplier=Mouser; ComponentLink1Description: https://datasheet.ciiva.com/5233/g5rl-0911-9106-5233888.pdf?src-supplier=Mouser
LED8-LED11 = NCD0603G2: Emerald 0603 Light Emitting Diodes (LED) ROHS; Manufacturer: Foshan NationStar Optoelectronics; Manufacturer Part Number: NCD0603G2; Package: 0603; LCSC Part Number: C87326; Item Type: LED; ComponentLink1Description: LCSC; ComponentLink1URL: https://www.lcsc.com/product-detail/Light-Emitting-Diodes-LED_Foshan-NationStar-Optoelectronics-NCD0603G2_C87326.html
Q5-Q8 = MMBT3904M: 40V 100mW 100@10mA,1V 200mA 300MHz 300mV@50mA,5mA NPN -55℃~+150℃@(Tj) SOT-723 Bipolar Transistors - BJT ROHS; Manufacturer: TECH PUBLIC; Item Type: Mosfet; ComponentLink1Description: LCSC; ComponentLink1URL: https://www.lcsc.com/product-detail/Bipolar-Transistors-BJT_TECH-PUBLIC-MMBT3904M_C2923360.html; Manufacturer Part Number: MMBT3904M; Package: SOT-723; LCSC Part Number: C2923360
R52-R55 = RC0402FR-074K7L: as R31 on sheet Controller-Sheet; Supplier 1: Avnet; Manufacturer Part Number: RC0402FR-074K7L; RoHS: Yes; Category: Chip SMD Resistors; Stock 1: 2420000; Pricing 1: 10000=0.00085 (USD); Case/Package: 0402; Number of Pins: 2; Case Code (Imperial): 0402; Case Code (Metric): 1005; Size Code: 0402; Min Operating Temperature: -55°C; Max Operating Temperature: 155°C; Tolerance: 1%; Voltage Rating: 50V; Packaging: Tape and Reel; Resistor Type: Thick Film; Termination: SMD/SMT; Features: Moisture Resistant; Series: RC; Number of Terminations: 2; Resistance Tolerance: 1%; Construction: Rectangular; Length: 1mm; Width: 0.5mm; Height: 0.32mm; Depth: 0.5mm; Height - Seated (Max): 0.016inch; RoHS Compliant: Yes; Reach SVHC Compliant: Yes; Military Standard: Not; Lead Free: Lead Free; ComponentLink1URL: https://datasheet.ciiva.com/22661/1686128-22661342.pdf?src-supplier=Element14; ComponentLink1Description: https://datasheet.ciiva.com/22661/1686128-22661342.pdf?src-supplier=Element14; ComponentLink2URL: https://datasheet.ciiva.com/7850/1018594-7850022.pdf?src-supplier=Element14; ComponentLink2Description: https://datasheet.ciiva.com/7850/1018594-7850022.pdf?src-supplier=Element14; ComponentLink3URL: https://datasheet.ciiva.com/7850/1018594-7850023.pdf?src-supplier=Element14; ComponentLink3Description: https://datasheet.ciiva.com/7850/1018594-7850023.pdf?src-supplier=Element14; ComponentLink4URL: https://datasheet.ciiva.com/15215/getdatasheetpartid-328119-15215035.pdf?src-supplier=Verical; ComponentLink4Description: https://datasheet.ciiva.com/15215/getdatasheetpartid-328119-15215035.pdf?src-supplier=Verical; Supplier Part Number 1: RC0402FR-074K7L; LCSC Part Number: C105871
R56-R59 = RC0402FR-0747KL: RES 47K OHM 1% 1/16W 0402; Manufacturer: Yageo; Power Rating: 62.5mW; Temperature Coefficient: 100ppm/°C; Voltage Rating: 50V; Resistance: 47kR; Max Power Dissipation: 63mW; Item Type: Resistor; Supplier 1: Avnet; Manufacturer Part Number: RC0402FR-0747KL; RoHS: Yes; Category: Chip SMD Resistors; Stock 1: 680000; Pricing 1: 10000=0.00085, 20000=0.00087, 40000=0.00084, 60000=0.00083, 80000=0.00079, 100000=0.00078, 1000000=0.00076 (USD); Case/Package: 0402; Case Code (Imperial): 0402; Case Code (Metric): 1005; Size Code: 0402; Min Operating Temperature: -55°C; Max Operating Temperature: 155°C; Tolerance: 1%; Series: RC; Packaging: Tape and Reel; Package Quantity: 1; Termination: SMD/SMT; Resistor Type: Thick Film; Number of Terminations: 2; Features: Moisture Resistant; Resistance Tolerance: 1%; Construction: Rectangular; Length: 1mm; Width: 0.02inch; Height: 0.016inch; Depth: 0.5mm; RoHS Compliant: Yes; Military Standard: Not; Lead Free: Lead Free; ComponentLink1URL: https://datasheet.ciiva.com/46412/1018594-46412839.pdf?src-supplier=Element14; ComponentLink1Description: https://datasheet.ciiva.com/46412/1018594-46412839.pdf?src-supplier=Element14; ComponentLink2URL: https://datasheet.ciiva.com/2453/pyu-r-int-thick-7-2453389.pdf?src-supplier=Digi-Key; ComponentLink2Description: https://datasheet.ciiva.com/2453/pyu-r-int-thick-7-2453389.pdf?src-supplier=Digi-Key; ComponentLink3URL: https://datasheet.ciiva.com/2453/pyu-r-int-thick-7-2453390.pdf?src-supplier=Digi-Key; ComponentLink3Description: https://datasheet.ciiva.com/2453/pyu-r-int-thick-7-2453390.pdf?src-supplier=Digi-Key; ComponentLink4URL: https://datasheet.ciiva.com/2453/pyu-r-int-thick-7-2453388.pdf?src-supplier=Digi-Key; ComponentLink4Description: https://datasheet.ciiva.com/2453/pyu-r-int-thick-7-2453388.pdf?src-supplier=Digi-Key; ComponentLink5URL: https://datasheet.ciiva.com/15189/getdatasheetpartid-323748-15189466.pdf?src-supplier=Verical; ComponentLink5Description: https://datasheet.ciiva.com/15189/getdatasheetpartid-323748-15189466.pdf?src-supplier=Verical; ComponentLink6URL: https://datasheet.ciiva.com/16793/pyu-rc0402-51-rohs-l-6-r-16793430.pdf?src-supplier=Future+Electronics; ComponentLink6Description: https://datasheet.ciiva.com/16793/pyu-rc0402-51-rohs-l-6-r-16793430.pdf?src-supplier=Future+Electronics; Supplier Part Number 1: RC0402FR-0747KL; LCSC Part Number: C93943
R60-R63 = RC0402FR-07680RL: RES 680 OHM 1% 1/16W 0402; Manufacturer: Yageo; Temperature Coefficient: 100ppm/°C; Power Rating: 63mW; Voltage Rating: 50V; Item Type: Resistor; Supplier 1: Future Electronics; Manufacturer Part Number: RC0402FR-07680RL; RoHS: Yes; Category: Chip SMD Resistors; Stock 1: 5080000; Pricing 1: 10000=0.0011, 100000=0.0011, 300000=0.001, 750000=0.001, 2000000=0.0009 (USD); Case/Package: 0402; Case Code (Imperial): 0402; Case Code (Metric): 1005; Size Code: 0402; Min Operating Temperature: -55°C; Max Operating Temperature: 155°C; Resistance: 680R; Tolerance: 1%; Packaging: Tape and Reel; Resistor Type: Thick Film; Termination: SMD/SMT; Features: Moisture Resistant; Series: RC; Max Power Dissipation: 63mW; Number of Terminations: 2; Resistance Tolerance: 1%; Construction: Rectangular; Voltage Rating (AC): 50V; Length: 1mm; Depth: 0.5mm; Reach SVHC Compliant: No; Lead Free: Lead Free; Military Standard: Not; RoHS Compliant: Yes; ComponentLink1URL: https://datasheet.ciiva.com/12667/pyu-rc0402-51-rohs-l-6-r-12667916.pdf?src-supplier=Mouser; ComponentLink1Description: https://datasheet.ciiva.com/12667/pyu-rc0402-51-rohs-l-6-r-12667916.pdf?src-supplier=Mouser; ComponentLink2URL: https://datasheet.ciiva.com/7850/1018594-7850071.pdf?src-supplier=Element14; ComponentLink2Description: https://datasheet.ciiva.com/7850/1018594-7850071.pdf?src-supplier=Element14; ComponentLink3URL: https://datasheet.ciiva.com/7850/1018594-7850070.pdf?src-supplier=Element14; ComponentLink3Description: https://datasheet.ciiva.com/7850/1018594-7850070.pdf?src-supplier=Element14; ComponentLink4URL: https://datasheet.ciiva.com/17042/pyu-rc0402-51-rohs-l-6-r-17042399.pdf?src-supplier=Future+Electronics; ComponentLink4Description: https://datasheet.ciiva.com/17042/pyu-rc0402-51-rohs-l-6-r-17042399.pdf?src-supplier=Future+Electronics; Supplier Part Number 1: 7948052

## Sheet Terminal-Sheet.SchDoc
size 420 x 297 mm; SheetNumber: 5; SheetTotal: 9
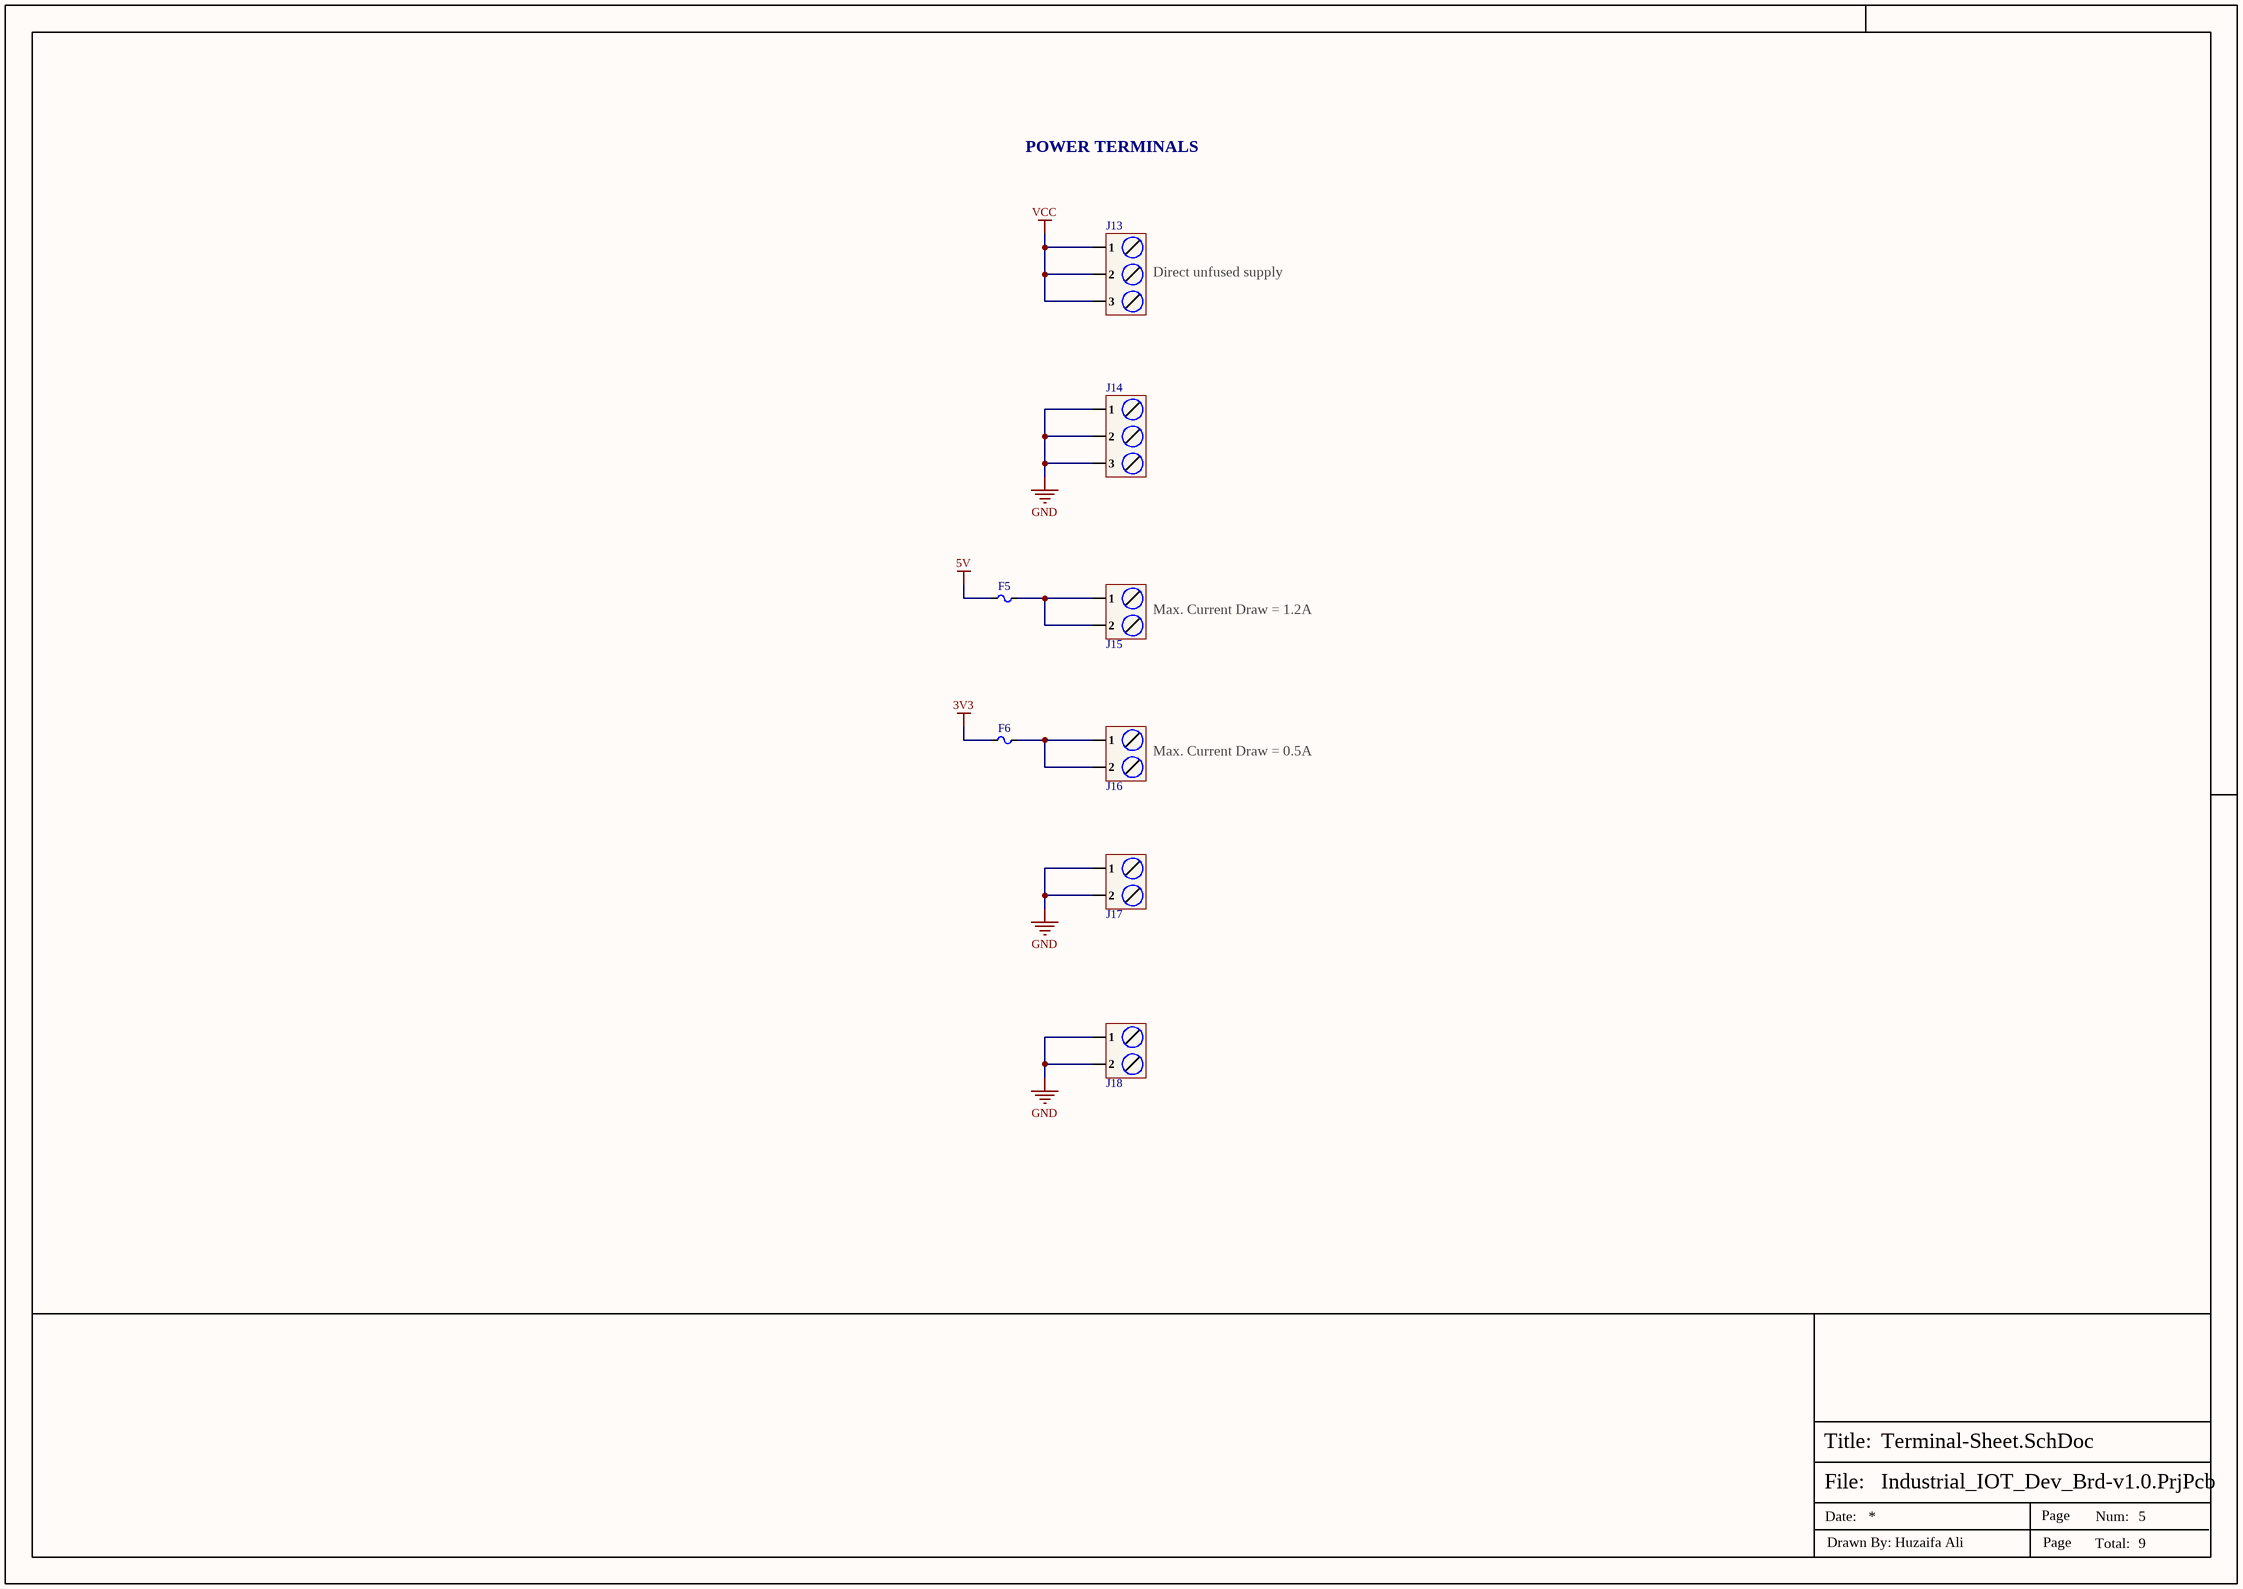
[diagram p4: Terminal-Sheet.SchDoc]

### Parts
F5  SMD0805B110TF  [Fuse-0805]  (value not drawn)
F6  0805L050WR  [Fuse-0805]  (value not drawn)
J13  DB128L-5.08-3P-GN-S  [DB128L-5.08-3P-GN-S]  (value not drawn)
J14  DB128L-5.08-3P-GN-S  [DB128L-5.08-3P-GN-S]  (value not drawn)
J15  DB128L-5.08-2P-GN-S  [DB128L-5.08-2P-GN-S]  (value not drawn)
J16  DB128L-5.08-2P-GN-S  [DB128L-5.08-2P-GN-S]  (value not drawn)
J17  DB128L-5.08-2P-GN-S  [DB128L-5.08-2P-GN-S]  (value not drawn)
J18  DB128L-5.08-2P-GN-S  [DB128L-5.08-2P-GN-S]  (value not drawn)

### Nets
3V3: F6.1
5V: F5.1
GND: J14.1 J14.2 J14.3 J17.1 J17.2 J18.1 J18.2
VCC: J13.1 J13.2 J13.3
NetF5_2: F5.2 J15.1 J15.2
NetF6_2: F6.2 J16.1 J16.2

### Notes on the sheet
- POWER TERMINALS
- (near J13) Direct unfused supply
- (near J15) Max. Current Draw = 1.2A
- (near J16) Max. Current Draw = 0.5A
- File:
- Title:
- Date:
- Page
- Num:
- Total:
- Drawn By: Huzaifa Ali

### Library data of the parts
F5 = SMD0805B110TF: PTC Resettable Fuse 6V 100A 2-Pin 0805 T/R; Manufacturer: Yageo; Item Type: PTC Resettable Fuses; Supplier: Digikey; LCSC Part Number: C269107; Manufacturer Part Number: SMD0805B110TF; RoHS: Yes; Stock: 3000; Pricing: 1=0.15, 5=0.126, 10=0.116, 50=0.0962, 100=0.0887, 250=0.07976, 500=0.07358, 1000=0.06788 (USD)
F6 = 0805L050WR: 6V 500mA 100A 1A 0805 Resettable Fuses ROHS; Manufacturer: Littelfuse; Item Type: Fuse; Supplier: DigiKey; Supplier Part Number: F2772CT-ND; Manufacturer Part Number: 0805L050WR; RoHS: Yes; Category: PTC Resettable Fuses; Stock: 52328; Pricing: 1=0.5, 5=0.41, 10=0.378, 50=0.314, 100=0.2897, 250=0.2604, 500=0.2402, 1000=0.2215 (USD); Voltage Rating: 6V; Width: 1.2mm; Height: 1.25mm; Lead Free: 5697LeadFree; ComponentLink1URL: https://datasheet.ciiva.com/326/littelfuse-ptc-0805l-326196.pdf?src-supplier=Digikey; ComponentLink1Description: https://datasheet.ciiva.com/326/littelfuse-ptc-0805l-326196.pdf?src-supplier=Digikey; ComponentLink2URL: https://datasheet.ciiva.com/4501/littelfuse-0805l-32472-4501285.pdf?src-supplier=Mouser; ComponentLink2Description: https://datasheet.ciiva.com/4501/littelfuse-0805l-32472-4501285.pdf?src-supplier=Mouser; ComponentLink3URL: https://datasheet.ciiva.com/28410/147852-28410764.pdf?src-supplier=Element14; ComponentLink3Description: https://datasheet.ciiva.com/28410/147852-28410764.pdf?src-supplier=Element14; ComponentLink4URL: https://datasheet.ciiva.com/8005/littelfuse-0805-8005343.pdf?src-supplier=Element14; ComponentLink4Description: https://datasheet.ciiva.com/8005/littelfuse-0805-8005343.pdf?src-supplier=Element14; ComponentLink5URL: https://datasheet.ciiva.com/1273/611626-1273580.pdf?src-supplier=Element14; ComponentLink5Description: https://datasheet.ciiva.com/1273/611626-1273580.pdf?src-supplier=Element14; ComponentLink6URL: https://datasheet.ciiva.com/15186/getdatasheetpartid-27833-15186860.pdf?src-supplier=Verical; ComponentLink6Description: https://datasheet.ciiva.com/15186/getdatasheetpartid-27833-15186860.pdf?src-supplier=Verical; ComponentLink7URL: https://datasheet.ciiva.com/16389/littelfuse-0805-16389019.pdf?src-supplier=Future+Electronics; ComponentLink7Description: https://datasheet.ciiva.com/16389/littelfuse-0805-16389019.pdf?src-supplier=Future+Electronics; ComponentLink8URL: https://datasheet.ciiva.com/326/littelfuse-ptc-0805l-326197.pdf?src-supplier=Digikey; ComponentLink8Description: https://datasheet.ciiva.com/326/littelfuse-ptc-0805l-326197.pdf?src-supplier=Digikey; ComponentLink9URL: https://datasheet.ciiva.com/326/littelfuse-ptc-0805l-326198.pdf?src-supplier=Digikey; ComponentLink9Description: https://datasheet.ciiva.com/326/littelfuse-ptc-0805l-326198.pdf?src-supplier=Digikey; LCSC Part Number: 0805L050WR
J13 J14 = DB128L-5.08-3P-GN-S: 1x3P 18A -40℃~+105℃ 250V Green 12~30 Direct Insert 5.08mm 2.5 1 3 Plugin,P=5.08mm Screw Terminal Blocks ROHS; Manufacturer: DORABO; Manufacturer Part Number: DB128L-5.08-3P-GN-S; Package: Plugin,P=5.08mm; LCSC Part Number: C395869; Item Type: Terminal Block; ComponentLink1Description: LCSC; ComponentLink1URL: https://www.lcsc.com/product-detail/Screw-Terminal-Blocks_DORABO-DB128L-5-08-3P-GN-S_C395869.html
J15-J18 = DB128L-5.08-2P-GN-S: as J9 on sheet Power-Relay-Sheet; Manufacturer Part Number: DB128L-5.08-2P-GN-S; Package: Plugin,P=5.08mm; LCSC Part Number: C395868; ComponentLink1Description: LCSC; ComponentLink1URL: https://www.lcsc.com/product-detail/Screw-terminal_DORABO-DB128L-5-08-2P-GN-S_C395868.html